# Altium project RK3588底板.PrjPcb (part 4 of 5)

## Sheet 10.PCIE2.SchDoc
size 297 x 209 mm; SheetNumber: 10; SheetTotal: 13
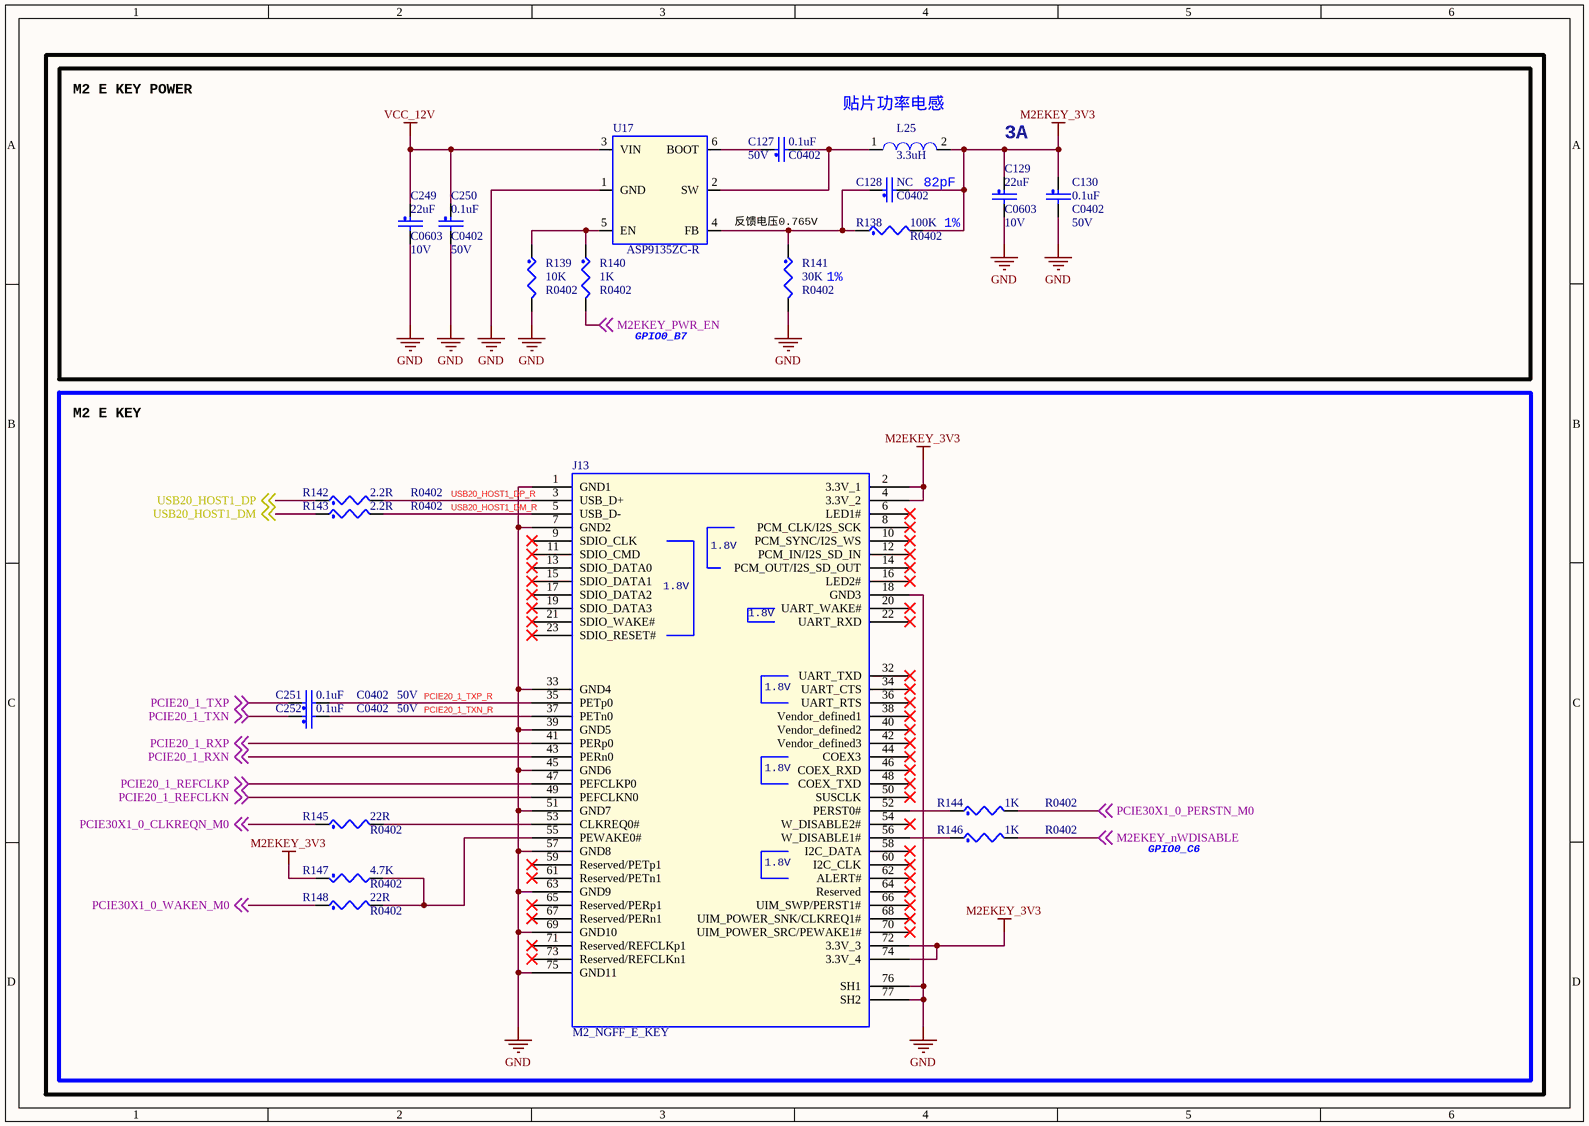
[diagram p9: 10.PCIE2.SchDoc]

### Parts
C127  0.1uF  Voltage: 50V  [C0402]
C128  NC  [C0402]
C129  22uF  Voltage: 10V  [C0603]
C130  0.1uF  Voltage: 50V  [C0402]
C249  22uF  Voltage: 10V  [C0603]
C250  0.1uF  Voltage: 50V  [C0402]
C251  0.1uF  Voltage: 50V  [C0402]
C252  0.1uF  Voltage: 50V  [C0402]
J13  M2_NGFF_E_KEY  [M2_NGFF_E_KEY]
L25  3.3uH  [l4520]
R138  100K  [R0402]
R139  10K  [R0402]
R140  1K  [R0402]
R141  30K  [R0402]
R142  2.2R  [R0402]
R143  2.2R  [R0402]
R144  1K  [R0402]
R145  22R  [R0402]
R146  1K  [R0402]
R147  4.7K  [R0402]
R148  22R  [R0402]
U17  ASP9135ZC-R  [SOT23_6]

### Blocks framed on the sheet
3A: C127-C130 C249 C250 L25 R138-R141 U17
M2 E KEY: C251 C252 J13 R142-R148

### Nets
GND: C129.2 C130.2 C249.2 C250.2 J13.1(GND1) J13.7(GND2) J13.18(GND3) J13.33(GND4) J13.39(GND5) J13.45(GND6) J13.51(GND7) J13.57(GND8) J13.63(GND9) J13.69(GND10) J13.75(GND11) J13.76(SH1) J13.77(SH2) R139.2 R141.2 U17.1(GND)
M2EKEY_3V3: C128.2 C129.1 C130.1 J13.2(3.3V_1) J13.4(3.3V_2) J13.72(3.3V_3) J13.74(3.3V_4) L25.2 R138.2 R147.1
VCC_12V: C249.1 C250.1 U17.3(VIN)
M2EKEY_nWDISABLE: R146.2 ; off-sheet M2EKEY_nWDISABLE  [project net GPIO0_C6]
M2EKEY_PWR_EN: R140.2 ; off-sheet M2EKEY_PWR_EN  [project net GPIO0_B7]
PCIE20_1_REFCLKN: J13.49(PEFCLKN0) ; off-sheet PCIE20_1_REFCLKN
PCIE20_1_REFCLKP: J13.47(PEFCLKP0) ; off-sheet PCIE20_1_REFCLKP
PCIE20_1_RXN: J13.43(PERn0) ; off-sheet PCIE20_1_RXN
PCIE20_1_RXP: J13.41(PERp0) ; off-sheet PCIE20_1_RXP
PCIE20_1_TXN: C252.1 ; off-sheet PCIE20_1_TXN
PCIE20_1_TXN_R: C252.2 J13.37(PETn0)
PCIE20_1_TXP: C251.1 ; off-sheet PCIE20_1_TXP
PCIE20_1_TXP_R: C251.2 J13.35(PETp0)
PCIE30X1_0_CLKREQN_M0: R145.1 ; off-sheet PCIE30X1_0_CLKREQN_M0
PCIE30X1_0_PERSTN_M0: R144.2 ; off-sheet PCIE30X1_0_PERSTN_M0
PCIE30X1_0_WAKEN_M0: R148.1 ; off-sheet PCIE30X1_0_WAKEN_M0
USB20_HOST1_DM: R143.1 ; off-sheet USB20_HOST1_DM
USB20_HOST1_DM_R: J13.5(USB_D-) R143.2
USB20_HOST1_DP: R142.1 ; off-sheet USB20_HOST1_DP
USB20_HOST1_DP_R: J13.3(USB_D+) R142.2
NetC127_1: C127.1 U17.6(BOOT)
NetC127_2: C127.2 L25.1 U17.2(SW)
NetC128_1: C128.1 R138.1 R141.1 U17.4(FB)
NetJ13_52: J13.52(PERST0#) R144.1
NetJ13_53: J13.53(CLKREQ0#) R145.2
NetJ13_55: J13.55(PEWAKE0#) R147.2 R148.2
NetJ13_56: J13.56(W_DISABLE1#) R146.1
NetR139_1: R139.1 R140.1 U17.5(EN)

Not connected (* = marked no-connect by the designer): J13 6(LED1#)* 8(PCM_CLK/I2S_SCK)* 9(SDIO_CLK)* 10(PCM_SYNC/I2S_WS)* 11(SDIO_CMD)* 12(PCM_IN/I2S_SD_IN)* 13(SDIO_DATA0)* 14(PCM_OUT/I2S_SD_OUT)* 15(SDIO_DATA1)* 16(LED2#)* 17(SDIO_DATA2)* 19(SDIO_DATA3)* 20(UART_WAKE#)* 21(SDIO_WAKE#)* 22(UART_RXD)* 23(SDIO_RESET#)* 32(UART_TXD)* 34(UART_CTS)* 36(UART_RTS)* 38(Vendor_defined1)* 40(Vendor_defined2)* 42(Vendor_defined3)* 44(COEX3)* 46(COEX_RXD)* 48(COEX_TXD)* 50(SUSCLK)* 54(W_DISABLE2#)* 58(I2C_DATA)* 59(Reserved/PETp1)* 60(I2C_CLK)* 61(Reserved/PETn1)* 62(ALERT#)* 64(Reserved)* 65(Reserved/PERp1)* 66(UIM_SWP/PERST1#)* 67(Reserved/PERn1)* 68(UIM_POWER_SNK/CLKREQ1#)* 70(UIM_POWER_SRC/PEWAKE1#)* 71(Reserved/REFCLKp1)* 73(Reserved/REFCLKn1)*

### Notes on the sheet
- M2 E KEY POWER
- (near L25) 贴片功率电感
- 82pF
- 反馈电压0.765V
- 1%
- GPIO0_B7
- GPIO0_C6
- (in symbol M2_NGFF_E_KEY) 1.8V

### Library data of the parts
C127 C251 C252 = CAP_NP: as C106 on sheet 6.音频_FAN_ADC_LED; PCB Footprint: C0402
C128 = CAP_NP: as C157 on sheet 9.PCIE3; Voltage: NC; PCB Footprint: C0402
C129 C249 = CAP_NP: as C160 on sheet 9.PCIE3; PCB Footprint: C0603
C130 C250 = CAP_NP: as C278 on sheet 6.音频_FAN_ADC_LED; PCB Footprint: C0402
J13 = M2_NGFF_E_KEY: 规格: M.2 NGFF 高度5.5MM M.2 E KEY连接器 75PIN; 规格编号: APCI0317-P001A; 条码: EBFCIS230525165441; 品牌: LOTES; 类别: 金手指连接器; 规格书: LOTES_APCI0317-P001A.pdf; 生命周期: 量产; 备注: RK3588 LBC5 M2无线网卡连接器; PCB Footprint: M2_NGFF_E_KEY
L25 = IND: CLASS: DISCRETE; 价格: 1.5992; 规格编号: TMPC0402HP-3R3MG-Z02; 生命周期: 量产; 规格书: 台庆-功率电感.pdf; 类别: 贴片电感0402; 品牌: 台庆; 条码: EBF29050040; 规格: 贴片电感3.3uH ±20% 3A 直流电阻69mΩ; PCB Footprint: l4520
R138 = RES: as R116 on sheet 6.音频_FAN_ADC_LED; PCB Footprint: R0402
R139 = RES: as R132 on sheet 6.音频_FAN_ADC_LED; PCB Footprint: R0402
R140 R144 R146 = RES: as R133 on sheet 6.音频_FAN_ADC_LED; PCB Footprint: R0402
R141 = RES: as R250 on sheet 9.PCIE3; PCB Footprint: R0402
R142 = RES: CLASS: DISCRETE; 生命周期: 量产; 价格: 0.003072; 规格书: 厚声-无铅厚膜电阻.pdf; 类别: 贴片电阻0402; 品牌: 厚声; 条码: EBF29070280; 规格编号: 0402WGF220KTCE; 规格: 贴片电阻2.2R 1% 1/16W 0402; PCB Footprint: R0402
R143 = RES: as R235 on sheet 9.PCIE3; PCB Footprint: R0402
R145 R148 = RES: as R230 on sheet 9.PCIE3; PCB Footprint: R0402
R147 = RES: as R224 on sheet 9.PCIE3; PCB Footprint: R0402
U17 = TP6327GS6: as U28 on sheet 9.PCIE3; 规格编号: ASP9135ZC-R; 可替代料: TP6327GS6; PCB Footprint: SOT23_6

## Sheet 11.MIPI DSI_CSI.SchDoc
size 297 x 209 mm; SheetNumber: 11; SheetTotal: 13
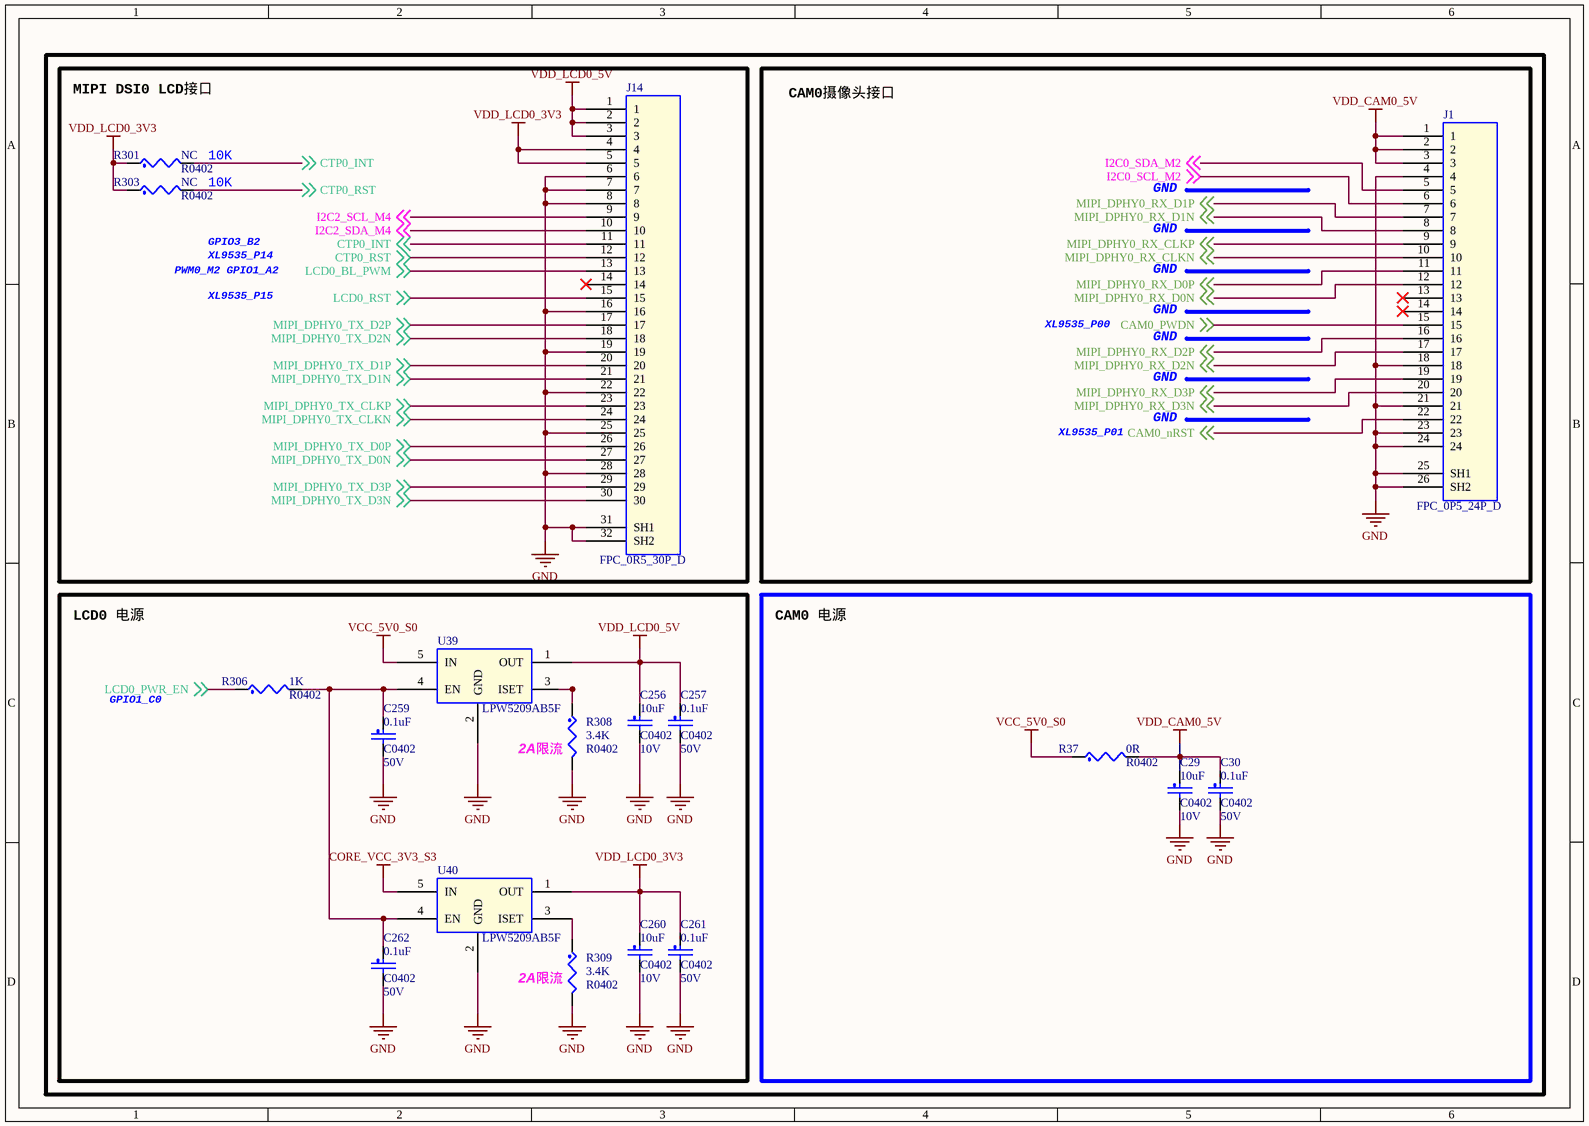
[diagram p10: 11.MIPI DSI_CSI.SchDoc]

### Parts
C29  10uF  Voltage: 10V  [C0402]
C30  0.1uF  Voltage: 50V  [C0402]
C256  10uF  Voltage: 10V  [C0402]
C257  0.1uF  Voltage: 50V  [C0402]
C259  0.1uF  Voltage: 50V  [C0402]
C260  10uF  Voltage: 10V  [C0402]
C261  0.1uF  Voltage: 50V  [C0402]
C262  0.1uF  Voltage: 50V  [C0402]
J1  FPC_0P5_24P_D  [fpc_24p_0p5]
J14  FPC_0R5_30P_D  [FPC-30P-0P5]
R37  0R  [R0402]
R301  NC  [R0402]
R303  NC  [R0402]
R306  1K  [R0402]
R308  3.4K  [R0402]
R309  3.4K  [R0402]
U39  LPW5209AB5F  [SOT23-5]
U40  LPW5209AB5F  [SOT23-5]

### Blocks framed on the sheet
MIPI DSI0 LCD接口: J14 R301 R303
CAM0摄像头接口: J1
LCD0 电源: C256 C257 C259-C262 R306 R308 R309 U39 U40
CAM0 电源: C29 C30 R37

### Nets
CORE_VCC_3V3_S3: U40.5(IN)
GND: C29.2 C30.2 C256.2 C257.2 C259.2 C260.2 C261.2 C262.2 J1.4 J1.18 J1.21 J1.23 J1.24 J1.25(SH1) J1.26(SH2) J14.6 J14.7 J14.8 J14.16 J14.19 J14.22 J14.25 J14.28 J14.31(SH1) J14.32(SH2) R308.2 R309.2 U39.2(GND) U40.2(GND)
VCC_5V0_S0: R37.1 U39.5(IN)
VDD_CAM0_5V: C29.1 C30.1 J1.1 J1.2 J1.3 R37.2
VDD_LCD0_3V3: C260.1 C261.1 J14.4 J14.5 R301.1 R303.1 U40.1(OUT)
VDD_LCD0_5V: C256.1 C257.1 J14.1 J14.2 J14.3 U39.1(OUT)
CAM0_nRST: J1.22 ; off-sheet CAM0_nRST
CAM0_PWDN: J1.15 ; off-sheet CAM0_PWDN
CTP0_INT: J14.11 R301.2 ; off-sheet CTP0_INT
CTP0_RST: J14.12 R303.2 ; off-sheet CTP0_RST
I2C0_SCL_M2: J1.6 ; off-sheet I2C0_SCL_M2
I2C0_SDA_M2: J1.5 ; off-sheet I2C0_SDA_M2
I2C2_SCL_M4: J14.9 ; off-sheet I2C2_SCL_M4
I2C2_SDA_M4: J14.10 ; off-sheet I2C2_SDA_M4
LCD0_BL_PWM: J14.13 ; off-sheet LCD0_BL_PWM  [project net GPIO1_A2]
LCD0_PWR_EN: R306.1 ; off-sheet LCD0_PWR_EN  [project net GPIO1_C0]
LCD0_RST: J14.15 ; off-sheet LCD0_RST
MIPI_DPHY0_RX_CLKN: J1.10 ; off-sheet MIPI_DPHY0_RX_CLKN
MIPI_DPHY0_RX_CLKP: J1.9 ; off-sheet MIPI_DPHY0_RX_CLKP
MIPI_DPHY0_RX_D0N: J1.12 ; off-sheet MIPI_DPHY0_RX_D0N
MIPI_DPHY0_RX_D0P: J1.11 ; off-sheet MIPI_DPHY0_RX_D0P
MIPI_DPHY0_RX_D1N: J1.8 ; off-sheet MIPI_DPHY0_RX_D1N
MIPI_DPHY0_RX_D1P: J1.7 ; off-sheet MIPI_DPHY0_RX_D1P
MIPI_DPHY0_RX_D2N: J1.17 ; off-sheet MIPI_DPHY0_RX_D2N
MIPI_DPHY0_RX_D2P: J1.16 ; off-sheet MIPI_DPHY0_RX_D2P
MIPI_DPHY0_RX_D3N: J1.20 ; off-sheet MIPI_DPHY0_RX_D3N
MIPI_DPHY0_RX_D3P: J1.19 ; off-sheet MIPI_DPHY0_RX_D3P
MIPI_DPHY0_TX_CLKN: J14.24 ; off-sheet MIPI_DPHY0_TX_CLKN
MIPI_DPHY0_TX_CLKP: J14.23 ; off-sheet MIPI_DPHY0_TX_CLKP
MIPI_DPHY0_TX_D0N: J14.27 ; off-sheet MIPI_DPHY0_TX_D0N
MIPI_DPHY0_TX_D0P: J14.26 ; off-sheet MIPI_DPHY0_TX_D0P
MIPI_DPHY0_TX_D1N: J14.21 ; off-sheet MIPI_DPHY0_TX_D1N
MIPI_DPHY0_TX_D1P: J14.20 ; off-sheet MIPI_DPHY0_TX_D1P
MIPI_DPHY0_TX_D2N: J14.18 ; off-sheet MIPI_DPHY0_TX_D2N
MIPI_DPHY0_TX_D2P: J14.17 ; off-sheet MIPI_DPHY0_TX_D2P
MIPI_DPHY0_TX_D3N: J14.30 ; off-sheet MIPI_DPHY0_TX_D3N
MIPI_DPHY0_TX_D3P: J14.29 ; off-sheet MIPI_DPHY0_TX_D3P
NetC259_1: C259.1 C262.1 R306.2 U39.4(EN) U40.4(EN)
NetR308_1: R308.1 U39.3(ISET)
NetR309_1: R309.1 U40.3(ISET)

Not connected (* = marked no-connect by the designer): J1 13* 14*; J14 14*

### Notes on the sheet
- 10K
- GND
- GPIO3_B2
- XL9535_P14
- PWM0_M2 GPIO1_A2
- XL9535_P15
- XL9535_P00
- XL9535_P01
- GPIO1_C0
- 2A限流

### Library data of the parts
C29 C260 = CAP_NP: as C111 on sheet 6.音频_FAN_ADC_LED; PCB Footprint: C0402
C30 C261 C262 = CAP_NP: as C278 on sheet 6.音频_FAN_ADC_LED; PCB Footprint: C0402
C256 = CAP_NP: as C123 on sheet 6.音频_FAN_ADC_LED; PCB Footprint: C0402
C257 C259 = CAP_NP: as C106 on sheet 6.音频_FAN_ADC_LED; PCB Footprint: C0402
J1 = FPC-24P: 规格: FPC连接器 针脚数24 间距0.5mmm 下接 卧贴 翻盖式; 规格编号: AFC01-S24FCA-00; 条码: EBF29040059; 品牌: 钜硕电子; 类别: FPC连接器; 规格书: 钜硕电子-FPC间距0.5mm.pdf; 价格: 0.368739; 生命周期: 量产; PCB Footprint: fpc_24p_0p5; 可替代料: EBF29040059
J14 = FPC-30P: 规格: FPC连接器 针脚数30 间距0.5mm 高度2.0mm 下接 卧贴 翻盖式; 规格编号: FPC-05F-30PH20; 条码: EBF29040079; 品牌: 讯普; 类别: FPC连接器; 规格书: FPC-05F-NPH20.pdf; 生命周期: 量产; PCB Footprint: FPC-30P-0P5
R37 = RES: as R114 on sheet 6.音频_FAN_ADC_LED; PCB Footprint: R0402
R301 R303 = RES: CLASS: DISCRETE; 类别: 贴片电阻0402; 条码: EBF29070087; 规格: 贴片电阻NC 预留; PCB Footprint: R0402
R306 = RES: as R351 on sheet 6.音频_FAN_ADC_LED; PCB Footprint: R0402
R308 = RES: CLASS: DISCRETE; 规格: 贴片电阻3.4K 1% 1/16W 0402; 规格编号: RI0402L3401FT; 条码: EBF29070186; 品牌: 合科泰; 类别: 贴片电阻0402; 规格书: 合科泰-RI系列电阻.pdf; 生命周期: 量产; PCB Footprint: R0402
R309 = RES: CLASS: DISCRETE; 生命周期: 量产; 规格书: 合科泰-RI系列电阻.pdf; 类别: 贴片电阻0402; 品牌: 合科泰; 条码: EBF29070186; 规格编号: RI0402L3401FT; 规格: 贴片电阻3.4K 1% 1/16W 0402; PCB Footprint: R0402
U39 U40 = LPW5209AB5F: 生命周期: 量产; 价格: 0.468063; 规格书: 微源半导体_LPW5209AB5F.pdf; 类别: 功率开关; 品牌: 微源半导体; 条码: EBF29280015; 规格: 集成电源开关 导通电阻：80mΩ 最大可设置保护电流：2.1A 输入电压：2.5V~6V 静态电流：30uA 其他功能：软启动、短路保护、热保护; PCB Footprint: SOT23-5; 规格编号: LPW5209AB5F